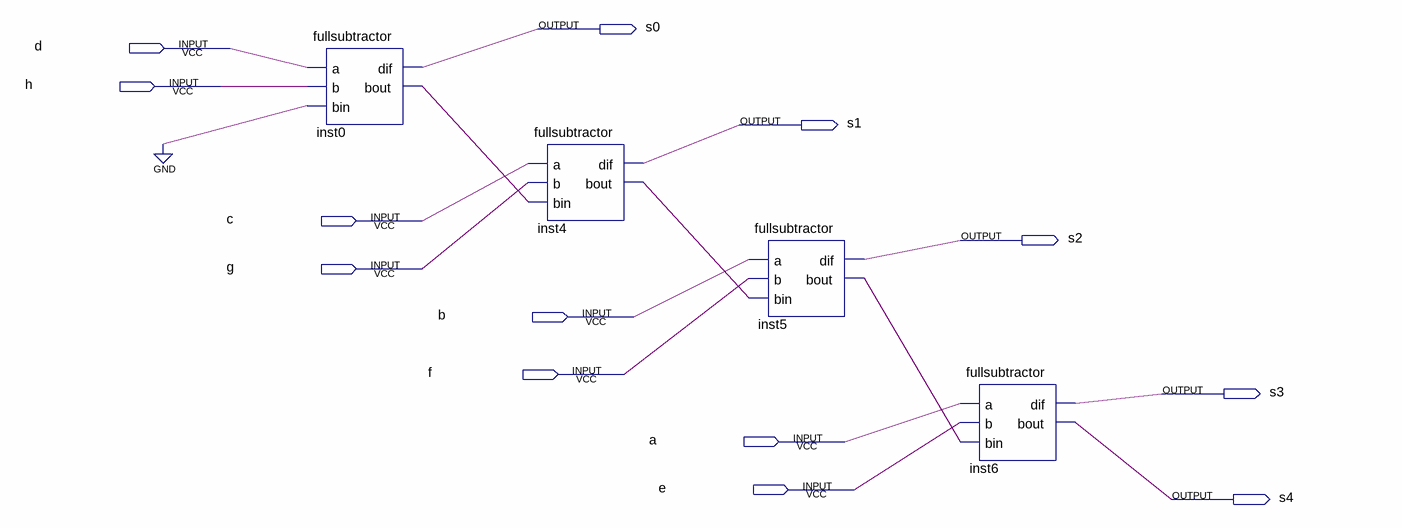
[diagram p0: schematic sheet]
// Quartus schematic subtrator2.bdf as structural Verilog: 4 symbols, 13 pins
module subtrator2 (
  input  d,
  input  h,
  input  c,
  input  g,
  input  b,
  input  f,
  input  a,
  input  e,
  output s0,
  output s1,
  output s2,
  output s3,
  output s4
);

  wire inst0_bout, inst4_bout, inst5_bout;

  fullsubtractor inst0 (.a(d), .b(h), .bin(1'b0), .dif(s0), .bout(inst0_bout));
  fullsubtractor inst4 (.a(c), .b(g), .bin(inst0_bout), .dif(s1), .bout(inst4_bout));
  fullsubtractor inst5 (.a(b), .b(f), .bin(inst4_bout), .dif(s2), .bout(inst5_bout));
  fullsubtractor inst6 (.a(a), .b(e), .bin(inst5_bout), .dif(s3), .bout(s4));
endmodule
